# EAGLE schematic WBS-Euro-rack_routing - REV 2 (EAGLE 6.6.0)
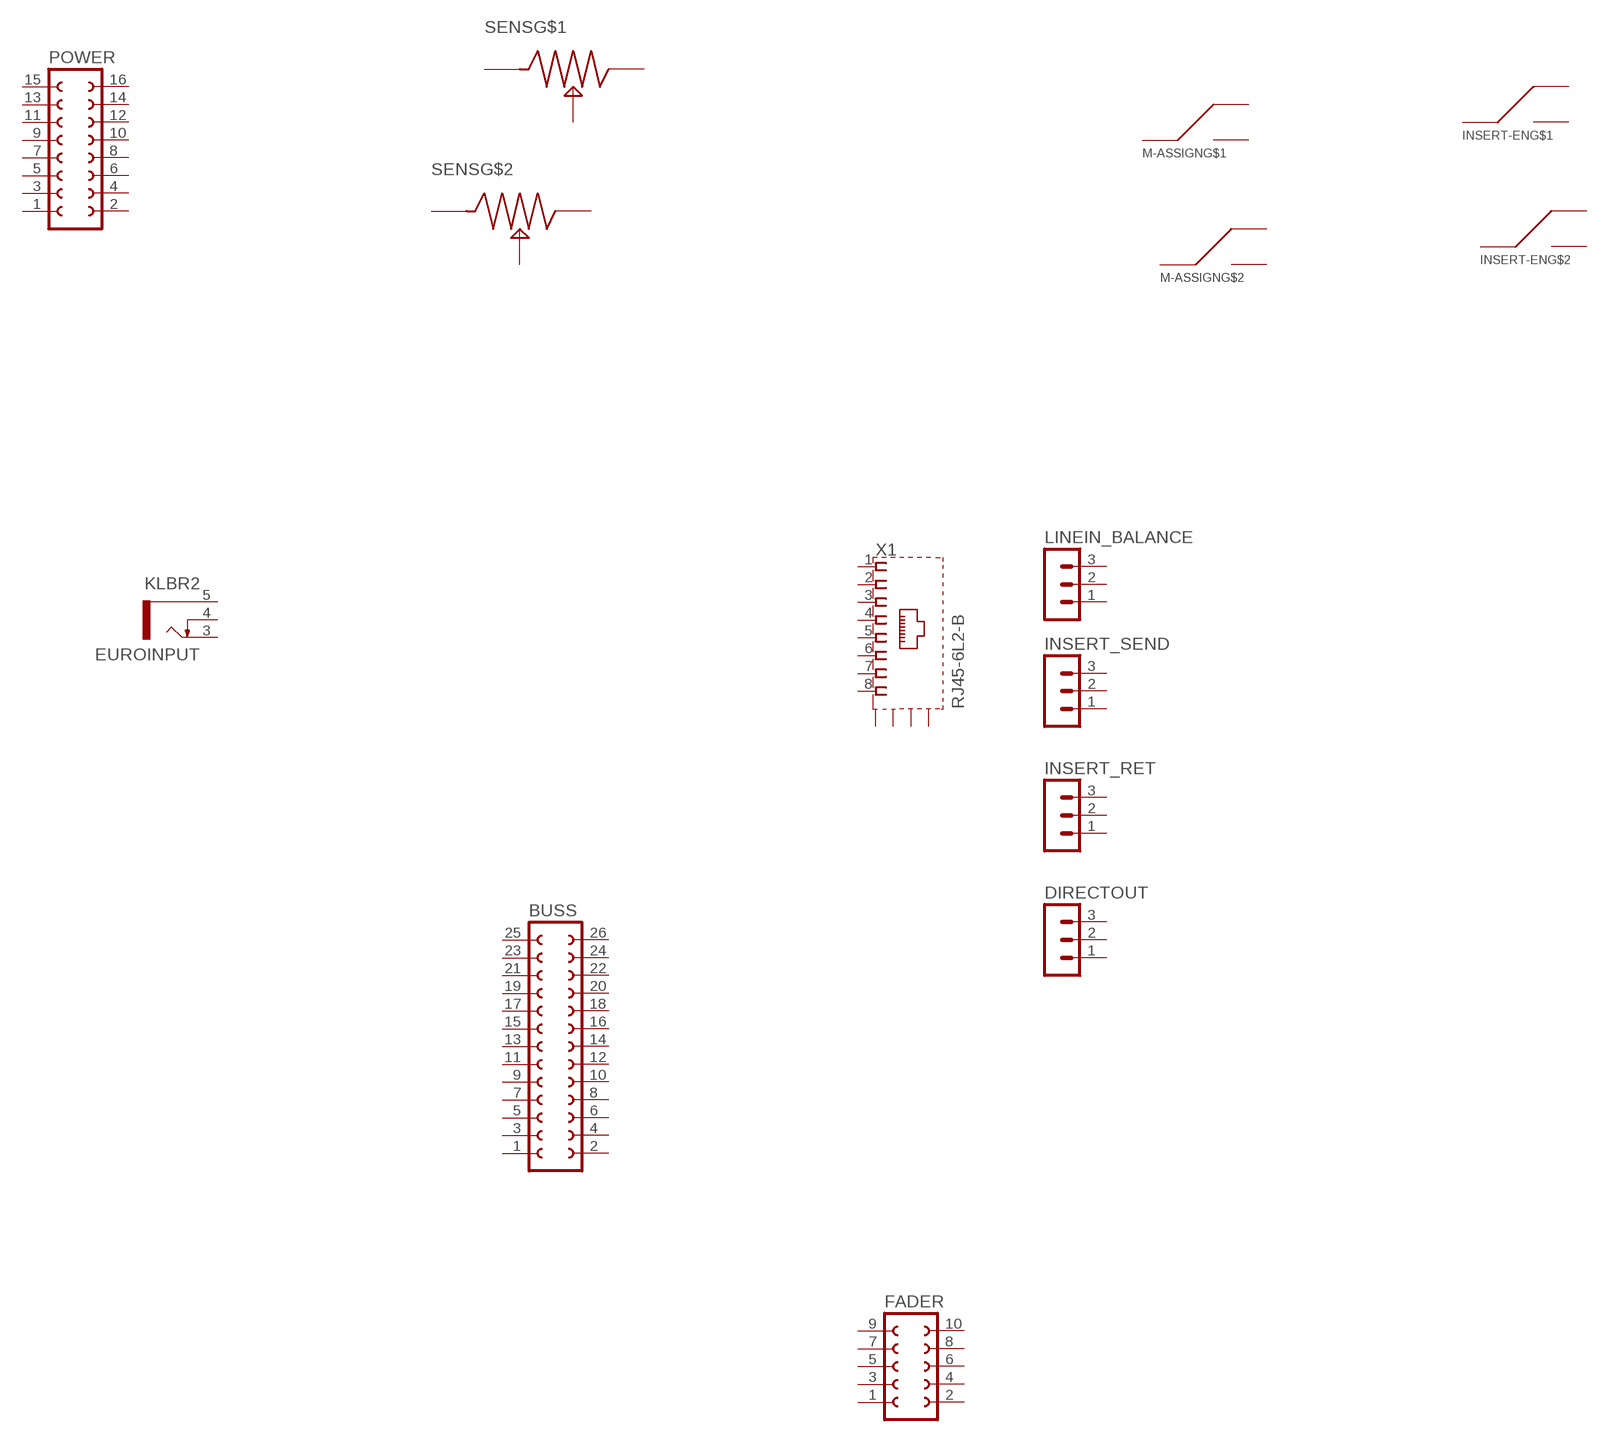
[diagram p0: schematic, sheet 1, part 1 of 2]
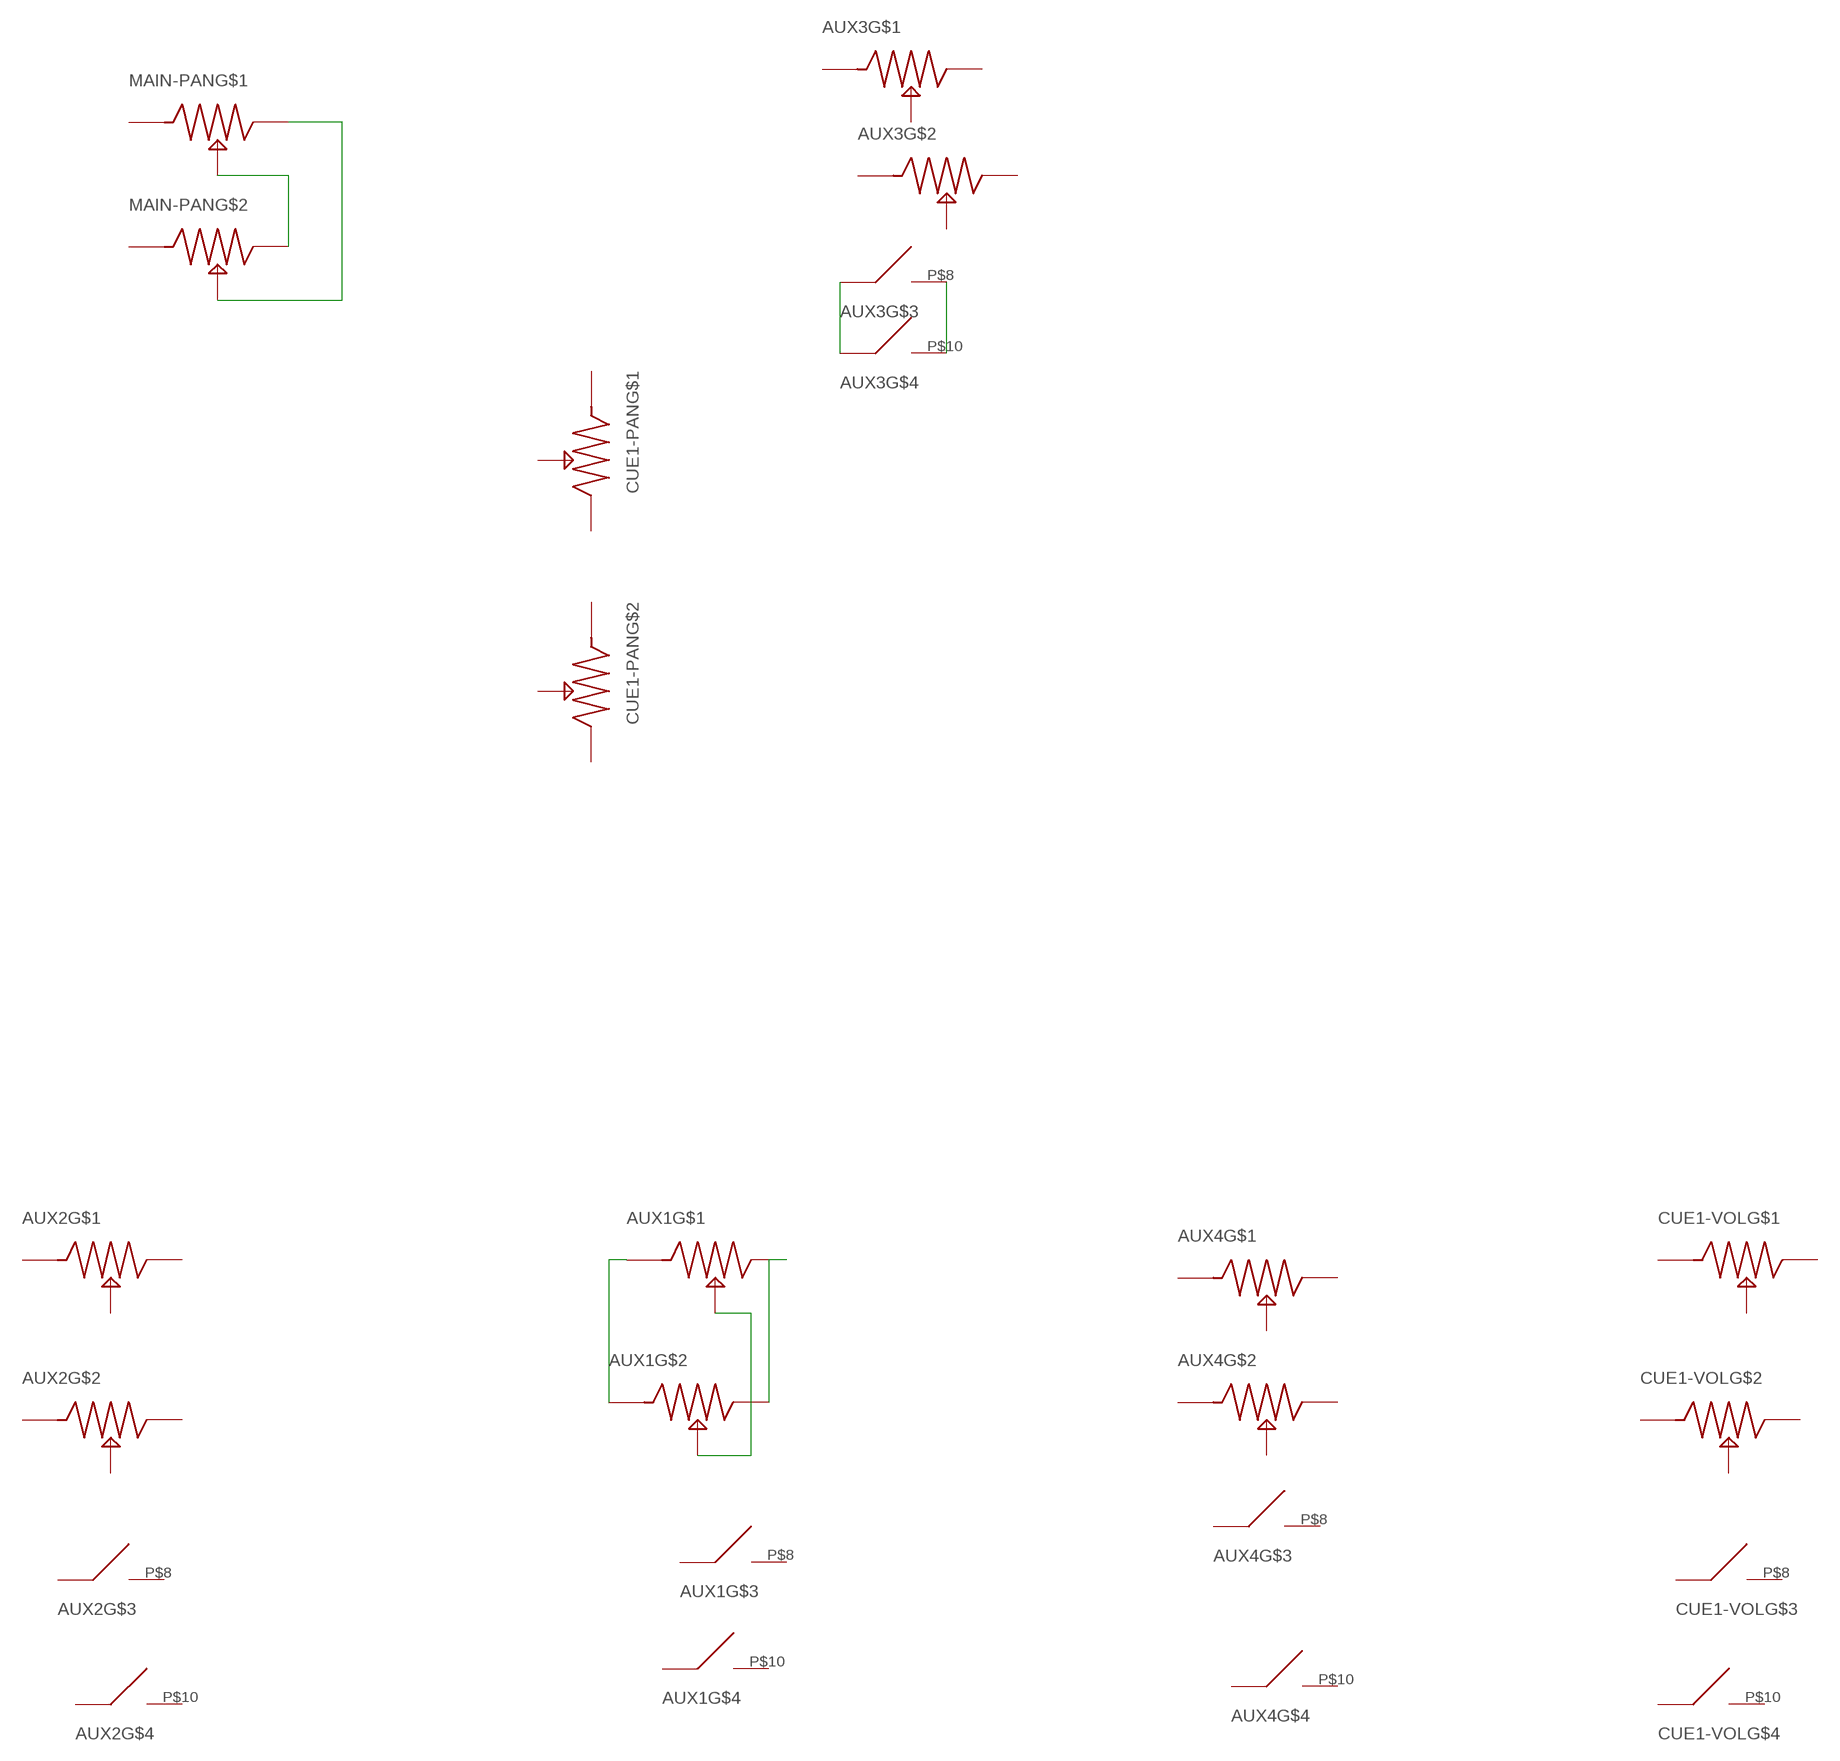
[diagram p1: schematic, sheet 1, part 2 of 2]

## Parts
AUX1  WBS_10-081_DUALPOT+DUALSWITCH  [WBS_10-081]
AUX2  WBS_10-081_DUALPOT+DUALSWITCH  [WBS_10-081]
AUX3  WBS_10-081_DUALPOT+DUALSWITCH  [WBS_10-081]
AUX4  WBS_10-081_DUALPOT+DUALSWITCH  [WBS_10-081]
BUSS  FE13-2  [FE13-2]
CUE1-PAN  WBS_10-079_POT  [WBS_079]
CUE1-VOL  WBS_10-081_DUALPOT+DUALSWITCH  [WBS_10-081]
DIRECTOUT  MA03-1  [MA03-1]
EUROINPUT  KLBR2  [KLBR2]
FADER  FE05-2  [FE05-2]
INSERT-EN  WBS_DPDT  [WBS_DPDT_SWITCH]
INSERT_RET  MA03-1  [MA03-1]
INSERT_SEND  MA03-1  [MA03-1]
LINEIN_BALANCE  MA03-1  [MA03-1]
M-ASSIGN  WBS_DPDT  [WBS_DPDT_SWITCH]
MAIN-PAN  WBS_10-079_POT  [WBS_079]
POWER  FE08-2  [FE08-2]
SENS  WBS_10-079_POT  [WBS_079]
X1  RJ45-6L2-B  [RJ45-SHIELD2]

## Nets
N$1: MAIN-PAN.P$3(CW) MAIN-PAN.P$5(WIPER)
N$2: MAIN-PAN.P$2(WIPER) MAIN-PAN.P$6(CW)
N$3: AUX3.P$7 AUX3.P$9
N$4: AUX3.P$8 AUX3.P$10
N$5: AUX1.P$3(CW) AUX1.P$6(CW)
N$6: AUX1.P$1(CCW) AUX1.P$4(CCW)
N$7: AUX1.P$2(WIPER) AUX1.P$5(WIPER)
Unconnected: AUX1.P$7 AUX1.P$8 AUX1.P$9 AUX1.P$10 AUX2.P$1(CCW) AUX2.P$2(WIPER) AUX2.P$3(CW) AUX2.P$4(CCW) AUX2.P$5(WIPER) AUX2.P$6(CW) AUX2.P$7 AUX2.P$8 AUX2.P$9 AUX2.P$10 AUX3.P$1(CCW) AUX3.P$2(WIPER) AUX3.P$3(CW) AUX3.P$4(CCW) AUX3.P$5(WIPER) AUX3.P$6(CW) AUX4.P$1(CCW) AUX4.P$2(WIPER) AUX4.P$3(CW) AUX4.P$4(CCW) AUX4.P$5(WIPER) AUX4.P$6(CW) AUX4.P$7 AUX4.P$8 AUX4.P$9 AUX4.P$10 BUSS.1 BUSS.2 BUSS.3 BUSS.4 BUSS.5 BUSS.6 BUSS.7 BUSS.8 BUSS.9 BUSS.10 BUSS.11 BUSS.12 BUSS.13 BUSS.14 BUSS.15 BUSS.16 BUSS.17 BUSS.18 BUSS.19 BUSS.20 BUSS.21 BUSS.22 BUSS.23 BUSS.24 BUSS.25 BUSS.26 CUE1-PAN.P$1(CCW) CUE1-PAN.P$2(WIPER) CUE1-PAN.P$3(CW) CUE1-PAN.P$4(CCW) CUE1-PAN.P$5(WIPER) CUE1-PAN.P$6(CW) CUE1-VOL.P$1(CCW) CUE1-VOL.P$2(WIPER) CUE1-VOL.P$3(CW) CUE1-VOL.P$4(CCW) CUE1-VOL.P$5(WIPER) CUE1-VOL.P$6(CW) CUE1-VOL.P$7 CUE1-VOL.P$8 CUE1-VOL.P$9 CUE1-VOL.P$10 DIRECTOUT.1 DIRECTOUT.2 DIRECTOUT.3 EUROINPUT.3 EUROINPUT.4 EUROINPUT.5 FADER.1 FADER.2 FADER.3 FADER.4 FADER.5 FADER.6 FADER.7 FADER.8 FADER.9 FADER.10 INSERT-EN.P$1(O) INSERT-EN.P$2(W) INSERT-EN.P$3(C) INSERT-EN.P$4(O) INSERT-EN.P$5(W) INSERT-EN.P$6(C) INSERT_RET.1 INSERT_RET.2 INSERT_RET.3 INSERT_SEND.1 INSERT_SEND.2 INSERT_SEND.3 LINEIN_BALANCE.1 LINEIN_BALANCE.2 LINEIN_BALANCE.3 M-ASSIGN.P$1(O) M-ASSIGN.P$2(W) M-ASSIGN.P$3(C) M-ASSIGN.P$4(O) M-ASSIGN.P$5(W) M-ASSIGN.P$6(C) MAIN-PAN.P$1(CCW) MAIN-PAN.P$4(CCW) POWER.1 POWER.2 POWER.3 POWER.4 POWER.5 POWER.6 POWER.7 POWER.8 POWER.9 POWER.10 POWER.11 POWER.12 POWER.13 POWER.14 POWER.15 POWER.16 SENS.P$1(CCW) SENS.P$2(WIPER) SENS.P$3(CW) SENS.P$4(CCW) SENS.P$5(WIPER) SENS.P$6(CW) X1.1 X1.2 X1.3 X1.4 X1.5 X1.6 X1.7 X1.8 X1.S1(S) X1.S2(S) X1.S3(S) X1.S4(S)

## Library data of the parts
AUX1-AUX4 CUE1-VOL = APK - PARTS:WBS_10-081_DUALPOT+DUALSWITCH
BUSS = con-lsta:FE13-2: FEMALE HEADER; OC_FARNELL: unknown; OC_NEWARK: unknown
CUE1-PAN MAIN-PAN SENS = APK - PARTS:WBS_10-079_POT
DIRECTOUT INSERT_RET INSERT_SEND LINEIN_BALANCE = con-lstb:MA03-1: PIN HEADER; OC_FARNELL: unknown; OC_NEWARK: unknown
EUROINPUT = con-lumberg:KLBR?: Jack connectors according to JISC 6560, 2.5mm / 3.5 mm Klinkensteckverbinder nach JISC 6560, 2.5mm / 3,5 mm Source: http://www.lumberg.com/Produkte/PDFs/KLBR2.pdf www.lumberg.com/Produkte/PDFs/KLBR1.pdf; OC_FARNELL: unknown; OC_NEWARK: unknown
FADER = con-lsta:FE05-2: FEMALE HEADER; OC_FARNELL: unknown; OC_NEWARK: unknown
INSERT-EN M-ASSIGN = APK - PARTS:WBS_DPDT
POWER = con-lsta:FE08-2: FEMALE HEADER; OC_FARNELL: unknown; OC_NEWARK: unknown
X1 = con-tycoelectronics:RJ45*2: RJ45 Low Profile Shield Type 2 For all RJ45 L, LC, LCT and X Series Models Source: www.tycoelectronics.com .. ENG_DS_1654001_1099_RJ_L_0507.pdf; MPN: RJ45-6L2-B; OC_FARNELL: unknown; OC_NEWARK: 16R6096